# Altium schematic sheet A_Input.SchDoc
size A; SheetNumber: 7; SheetTotal: 9
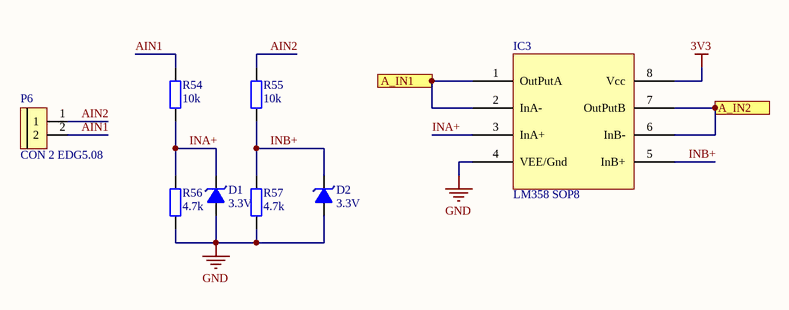
[diagram p0: A_Input.SchDoc]

## Parts
D1  3.3V  [DIODE ZENNER SMD SOD80]
D2  3.3V  [DIODE ZENNER SMD SOD80]
IC3  LM358 SOP8  [SOP 8]
P6  CON 2 EDG5.08  [CON 2 2EDG5.08]
R54  10k  [tro smd 0805]
R55  10k  [tro smd 0805]
R56  4.7k  [tro smd 0805]
R57  4.7k  [tro smd 0805]

## Ports
A_IN1 (out), A_IN2 (out)

## Nets
3V3: IC3.8(Vcc)
GND: D1.1(A) D2.1(A) IC3.4(VEE/Gnd) R56.1 R57.1
A_IN1: IC3.1(OutPutA) IC3.2(InA-) ; port A_IN1
A_IN2: IC3.6(InB-) IC3.7(OutPutB) ; port A_IN2
AIN1: P6.2 R54.2
AIN2: P6.1 R55.2
INA+: D1.2(K) IC3.3(InA+) R54.1 R56.2
INB+: D2.2(K) IC3.5(InB+) R55.1 R57.2

## Library data of the parts
D1 D2 = Diode Zener 3.3V: Dán; Don_Vi: Con; Ma_Hang: MH002880; Ten_Linh_Kien: Diode Zener 1/2W 3.3V SMD1206 ZMM3.3; Kieu_Chan: *; Ghi_Chu: *; Chung_Loai: Dán
IC3 = LM358 SOP8: Dán; Ma_Hang: MH000609; Don_Vi: Con; Ten_Linh_Kien: LM358 SOP8; Kieu_Chan: *; Ghi_Chu: *; Chung_Loai: Dán
P6 = CON 2 EDG5.08: Cắm; Ten_Linh_Kien: CON 2 2EDG5.08-2P 5.08MM ( Xanh Cong); Ma_Hang: MH000759; Ghi_Chu: *; Don_Vi: Con; Kieu_Chan: *; Chung_Loai: Cắm
R54 R55 = Tro 0805 1% 10k: Dán; Don_Vi: Con; So_Chan: 2; Ten_Linh_Kien: Trở 0805 1% 10k; Ma_Hang: MH005473; Chung_Loai: Dán; Kieu_Chan: *
R56 R57 = Tro 0805 5% 4.7k: Dán; Don_Vi: Con; So_Chan: 2; Ten_Linh_Kien: Trở 0805 5% 4.7k; Ma_Hang: MH005307; Chung_Loai: Dán; Kieu_Chan: *